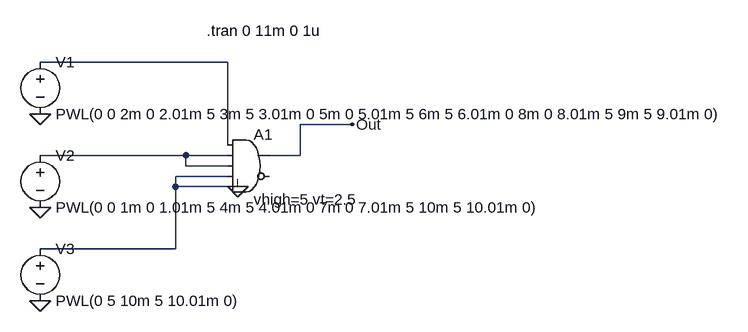
[diagram p0: schematic 3_Input_AND_Correct.asc]
3_Input_AND_Correct.asc, the LTspice schematic file:
Version 4.1
SHEET 1 1228 680
WIRE 384 128 96 128
WIRE 576 224 496 224
WIRE 384 256 384 128
WIRE 320 272 96 272
WIRE 384 272 320 272
WIRE 496 272 496 224
WIRE 496 272 448 272
WIRE 320 288 320 272
WIRE 384 288 320 288
WIRE 384 304 304 304
WIRE 304 320 304 304
WIRE 384 320 304 320
WIRE 304 416 304 320
WIRE 304 416 96 416
FLAG 576 224 Out
FLAG 96 208 0
FLAG 96 352 0
FLAG 96 496 0
FLAG 400 320 0
SYMBOL and 416 224 R0
SYMATTR InstName A1
SYMATTR Value vhigh=5 vt=2.5
SYMBOL voltage 96 112 R0
WINDOW 123 0 0 Left 0
WINDOW 39 0 0 Left 0
SYMATTR InstName V1
SYMATTR Value PWL(0 0 2m 0 2.01m 5 3m 5 3.01m 0 5m 0 5.01m 5 6m 5 6.01m 0 8m 0 8.01m 5 9m 5 9.01m 0)
SYMBOL voltage 96 256 R0
WINDOW 123 0 0 Left 0
WINDOW 39 0 0 Left 0
SYMATTR InstName V2
SYMATTR Value PWL(0 0 1m 0 1.01m 5 4m 5 4.01m 0 7m 0 7.01m 5 10m 5 10.01m 0)
SYMBOL voltage 96 400 R0
WINDOW 123 0 0 Left 0
WINDOW 39 0 0 Left 0
SYMATTR InstName V3
SYMATTR Value PWL(0 5 10m 5 10.01m 0)
TEXT 352 80 Left 2 !.tran 0 11m 0 1u

The netlist it stands for:
* 3_Input_AND_Correct.asc
A1 N001 N002 N002 N003 N003 0 Out 0 AND vhigh=5 vt=2.5
V1 N001 0 PWL(0 0 2m 0 2.01m 5 3m 5 3.01m 0 5m 0 5.01m 5 6m 5 6.01m 0 8m 0 8.01m 5 9m 5 9.01m 0)
V2 N002 0 PWL(0 0 1m 0 1.01m 5 4m 5 4.01m 0 7m 0 7.01m 5 10m 5 10.01m 0)
V3 N003 0 PWL(0 5 10m 5 10.01m 0)
.tran 0 11m 0 1u
.backanno
.end